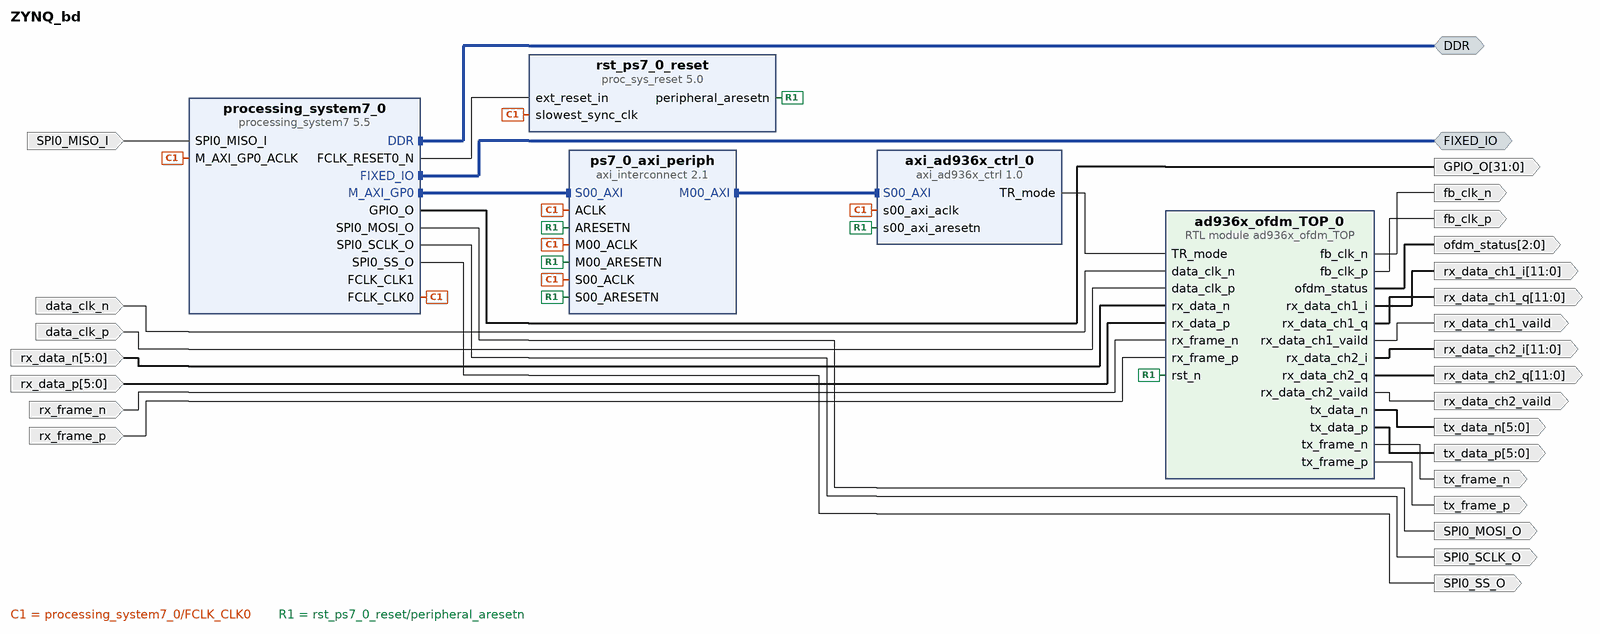
[diagram p0: block diagram of the top level]
# Vivado block design ZYNQ_bd, xc7z020clg400-2, Vivado 2022.1
create_bd_design ZYNQ_bd

create_bd_intf_port -mode Master -vlnv xilinx.com:interface:ddrx_rtl:1.0 DDR
create_bd_intf_port -mode Master -vlnv xilinx.com:display_processing_system7:fixedio_rtl:1.0 FIXED_IO
create_bd_port -dir I -from 5 -to 0 rx_data_p
create_bd_port -dir I rx_frame_p
create_bd_port -dir I -from 5 -to 0 rx_data_n
create_bd_port -dir I rx_frame_n
create_bd_port -dir O tx_frame_p
create_bd_port -dir O -from 5 -to 0 tx_data_p
create_bd_port -dir O -type clk fb_clk_n
create_bd_port -dir O -type clk fb_clk_p
create_bd_port -dir O -from 5 -to 0 tx_data_n
create_bd_port -dir O tx_frame_n
create_bd_port -dir O -from 31 -to 0 GPIO_O
create_bd_port -dir O SPI0_SCLK_O
create_bd_port -dir O SPI0_MOSI_O
create_bd_port -dir O SPI0_SS_O
create_bd_port -dir I SPI0_MISO_I
create_bd_port -dir I -type clk data_clk_n
create_bd_port -dir I -type clk data_clk_p
create_bd_port -dir O -from 11 -to 0 rx_data_ch1_i
create_bd_port -dir O -from 11 -to 0 rx_data_ch1_q
create_bd_port -dir O -from 11 -to 0 rx_data_ch2_i
create_bd_port -dir O -from 11 -to 0 rx_data_ch2_q
create_bd_port -dir O rx_data_ch1_vaild
create_bd_port -dir O rx_data_ch2_vaild
create_bd_port -dir O -from 2 -to 0 ofdm_status

create_bd_cell -type ip -vlnv xilinx.com:ip:processing_system7:5.5 processing_system7_0
set_property -dict [list \
  CONFIG.PCW_APU_PERIPHERAL_FREQMHZ 666.666666 \
  CONFIG.PCW_CPU_CPU_6X4X_MAX_RANGE 767 \
  CONFIG.PCW_ENET0_PERIPHERAL_ENABLE 0 \
  CONFIG.PCW_EN_CLK1_PORT 1 \
  CONFIG.PCW_FCLK_CLK1_BUF TRUE \
  CONFIG.PCW_FPGA0_PERIPHERAL_FREQMHZ 100 \
  CONFIG.PCW_FPGA1_PERIPHERAL_FREQMHZ 200 \
  CONFIG.PCW_FPGA_FCLK1_ENABLE 1 \
  CONFIG.PCW_GPIO_EMIO_GPIO_ENABLE 1 \
  CONFIG.PCW_GPIO_EMIO_GPIO_IO 32 \
  CONFIG.PCW_GPIO_EMIO_GPIO_WIDTH 32 \
  CONFIG.PCW_GPIO_MIO_GPIO_ENABLE 1 \
  CONFIG.PCW_GPIO_MIO_GPIO_IO MIO \
  CONFIG.PCW_I2C_RESET_ENABLE 0 \
  CONFIG.PCW_PERIPHERAL_BOARD_PRESET None \
  CONFIG.PCW_PRESET_BANK1_VOLTAGE {LVCMOS 1.8V} \
  CONFIG.PCW_QSPI_GRP_FBCLK_ENABLE 1 \
  CONFIG.PCW_QSPI_GRP_FBCLK_IO {MIO 8} \
  CONFIG.PCW_QSPI_GRP_SINGLE_SS_ENABLE 1 \
  CONFIG.PCW_QSPI_GRP_SINGLE_SS_IO {MIO 1 .. 6} \
  CONFIG.PCW_QSPI_PERIPHERAL_ENABLE 1 \
  CONFIG.PCW_QSPI_QSPI_IO {MIO 1 .. 6} \
  CONFIG.PCW_SD0_PERIPHERAL_ENABLE 0 \
  CONFIG.PCW_SINGLE_QSPI_DATA_MODE x4 \
  CONFIG.PCW_SPI0_PERIPHERAL_ENABLE 1 \
  CONFIG.PCW_SPI0_SPI0_IO EMIO \
  CONFIG.PCW_UART1_PERIPHERAL_ENABLE 1 \
  CONFIG.PCW_UART1_UART1_IO {MIO 12 .. 13} \
  CONFIG.PCW_UART_PERIPHERAL_FREQMHZ 100 \
  CONFIG.PCW_UIPARAM_DDR_BUS_WIDTH {16 Bit} \
  CONFIG.PCW_UIPARAM_DDR_FREQ_MHZ 533.333333 \
  CONFIG.PCW_UIPARAM_DDR_PARTNO {MT41K256M16 RE-125} \
  CONFIG.PCW_USB0_PERIPHERAL_ENABLE 0 \
  CONFIG.PCW_USB_RESET_ENABLE 0 \
  CONFIG.preset None \
] [get_bd_cells processing_system7_0]
# 490 more settings of processing_system7_0 are not shown: defaults, MIO pin electricals, DDR timing, and values the tool derives
create_bd_cell -type ip -vlnv xilinx.com:ip:proc_sys_reset:5.0 rst_ps7_0_reset
create_bd_cell -type ip -vlnv xilinx.com:user:axi_ad936x_ctrl:1.0 axi_ad936x_ctrl_0
create_bd_cell -type ip -vlnv xilinx.com:ip:axi_interconnect:2.1 ps7_0_axi_periph
set_property -dict {CONFIG.NUM_MI 1} [get_bd_cells ps7_0_axi_periph]
create_bd_cell -type module -reference ad936x_ofdm_TOP ad936x_ofdm_TOP_0

# ---- connections ----

connect_bd_intf_net [get_bd_intf_ports DDR] [get_bd_intf_pins processing_system7_0/DDR]
connect_bd_intf_net [get_bd_intf_ports FIXED_IO] [get_bd_intf_pins processing_system7_0/FIXED_IO]
connect_bd_intf_net [get_bd_intf_pins processing_system7_0/M_AXI_GP0] [get_bd_intf_pins ps7_0_axi_periph/S00_AXI]
connect_bd_intf_net [get_bd_intf_pins ps7_0_axi_periph/M00_AXI] [get_bd_intf_pins axi_ad936x_ctrl_0/S00_AXI]
connect_bd_net -net SPI0_MISO_I_0_1 [get_bd_ports SPI0_MISO_I] [get_bd_pins processing_system7_0/SPI0_MISO_I]
connect_bd_net [get_bd_pins ad936x_ofdm_TOP_0/ofdm_status] [get_bd_ports ofdm_status]
connect_bd_net [get_bd_pins ad936x_ofdm_TOP_0/rx_data_ch1_i] [get_bd_ports rx_data_ch1_i]
connect_bd_net [get_bd_pins ad936x_ofdm_TOP_0/rx_data_ch1_q] [get_bd_ports rx_data_ch1_q]
connect_bd_net [get_bd_pins ad936x_ofdm_TOP_0/rx_data_ch1_vaild] [get_bd_ports rx_data_ch1_vaild]
connect_bd_net [get_bd_pins ad936x_ofdm_TOP_0/rx_data_ch2_i] [get_bd_ports rx_data_ch2_i]
connect_bd_net [get_bd_pins ad936x_ofdm_TOP_0/rx_data_ch2_q] [get_bd_ports rx_data_ch2_q]
connect_bd_net [get_bd_pins ad936x_ofdm_TOP_0/rx_data_ch2_vaild] [get_bd_ports rx_data_ch2_vaild]
connect_bd_net -net ad936x_phy_TOP_0_fb_clk_n [get_bd_pins ad936x_ofdm_TOP_0/fb_clk_n] [get_bd_ports fb_clk_n]
connect_bd_net -net ad936x_phy_TOP_0_fb_clk_p [get_bd_pins ad936x_ofdm_TOP_0/fb_clk_p] [get_bd_ports fb_clk_p]
connect_bd_net -net ad936x_phy_TOP_0_tx_data_n [get_bd_pins ad936x_ofdm_TOP_0/tx_data_n] [get_bd_ports tx_data_n]
connect_bd_net -net ad936x_phy_TOP_0_tx_data_p [get_bd_pins ad936x_ofdm_TOP_0/tx_data_p] [get_bd_ports tx_data_p]
connect_bd_net -net ad936x_phy_TOP_0_tx_frame_n [get_bd_pins ad936x_ofdm_TOP_0/tx_frame_n] [get_bd_ports tx_frame_n]
connect_bd_net -net ad936x_phy_TOP_0_tx_frame_p [get_bd_pins ad936x_ofdm_TOP_0/tx_frame_p] [get_bd_ports tx_frame_p]
connect_bd_net [get_bd_pins axi_ad936x_ctrl_0/TR_mode] [get_bd_pins ad936x_ofdm_TOP_0/TR_mode]
connect_bd_net -net data_clk_n_0_1 [get_bd_ports data_clk_n] [get_bd_pins ad936x_ofdm_TOP_0/data_clk_n]
connect_bd_net -net data_clk_p_0_1 [get_bd_ports data_clk_p] [get_bd_pins ad936x_ofdm_TOP_0/data_clk_p]
connect_bd_net [get_bd_pins processing_system7_0/FCLK_CLK0] \
  [get_bd_pins processing_system7_0/M_AXI_GP0_ACLK] [get_bd_pins rst_ps7_0_reset/slowest_sync_clk] \
  [get_bd_pins axi_ad936x_ctrl_0/s00_axi_aclk] [get_bd_pins ps7_0_axi_periph/ACLK] [get_bd_pins ps7_0_axi_periph/S00_ACLK] \
  [get_bd_pins ps7_0_axi_periph/M00_ACLK]
# net processing_system7_0_FCLK_CLK1 has one end: processing_system7_0/FCLK_CLK1
connect_bd_net [get_bd_pins processing_system7_0/FCLK_RESET0_N] [get_bd_pins rst_ps7_0_reset/ext_reset_in]
connect_bd_net [get_bd_pins processing_system7_0/GPIO_O] [get_bd_ports GPIO_O]
connect_bd_net [get_bd_pins processing_system7_0/SPI0_MOSI_O] [get_bd_ports SPI0_MOSI_O]
connect_bd_net [get_bd_pins processing_system7_0/SPI0_SCLK_O] [get_bd_ports SPI0_SCLK_O]
connect_bd_net [get_bd_pins processing_system7_0/SPI0_SS_O] [get_bd_ports SPI0_SS_O]
connect_bd_net -net rst_ps7_0_100M_peripheral_aresetn [get_bd_pins rst_ps7_0_reset/peripheral_aresetn] \
  [get_bd_pins axi_ad936x_ctrl_0/s00_axi_aresetn] [get_bd_pins ps7_0_axi_periph/ARESETN] \
  [get_bd_pins ps7_0_axi_periph/S00_ARESETN] [get_bd_pins ps7_0_axi_periph/M00_ARESETN] [get_bd_pins ad936x_ofdm_TOP_0/rst_n]
connect_bd_net -net rx_data_n_0_1 [get_bd_ports rx_data_n] [get_bd_pins ad936x_ofdm_TOP_0/rx_data_n]
connect_bd_net -net rx_data_p_0_1 [get_bd_ports rx_data_p] [get_bd_pins ad936x_ofdm_TOP_0/rx_data_p]
connect_bd_net -net rx_frame_n_0_1 [get_bd_ports rx_frame_n] [get_bd_pins ad936x_ofdm_TOP_0/rx_frame_n]
connect_bd_net -net rx_frame_p_0_1 [get_bd_ports rx_frame_p] [get_bd_pins ad936x_ofdm_TOP_0/rx_frame_p]

# ---- address map ----
assign_bd_address -offset 0x43C00000 -range 64K -target_address_space [get_bd_addr_spaces processing_system7_0/Data] [get_bd_addr_segs axi_ad936x_ctrl_0/S00_AXI/S00_AXI_reg]

validate_bd_design
save_bd_design
